# Altium schematic sheet Relay-Sheet.SchDoc
size A4; SheetNumber: 8; SheetTotal: 8
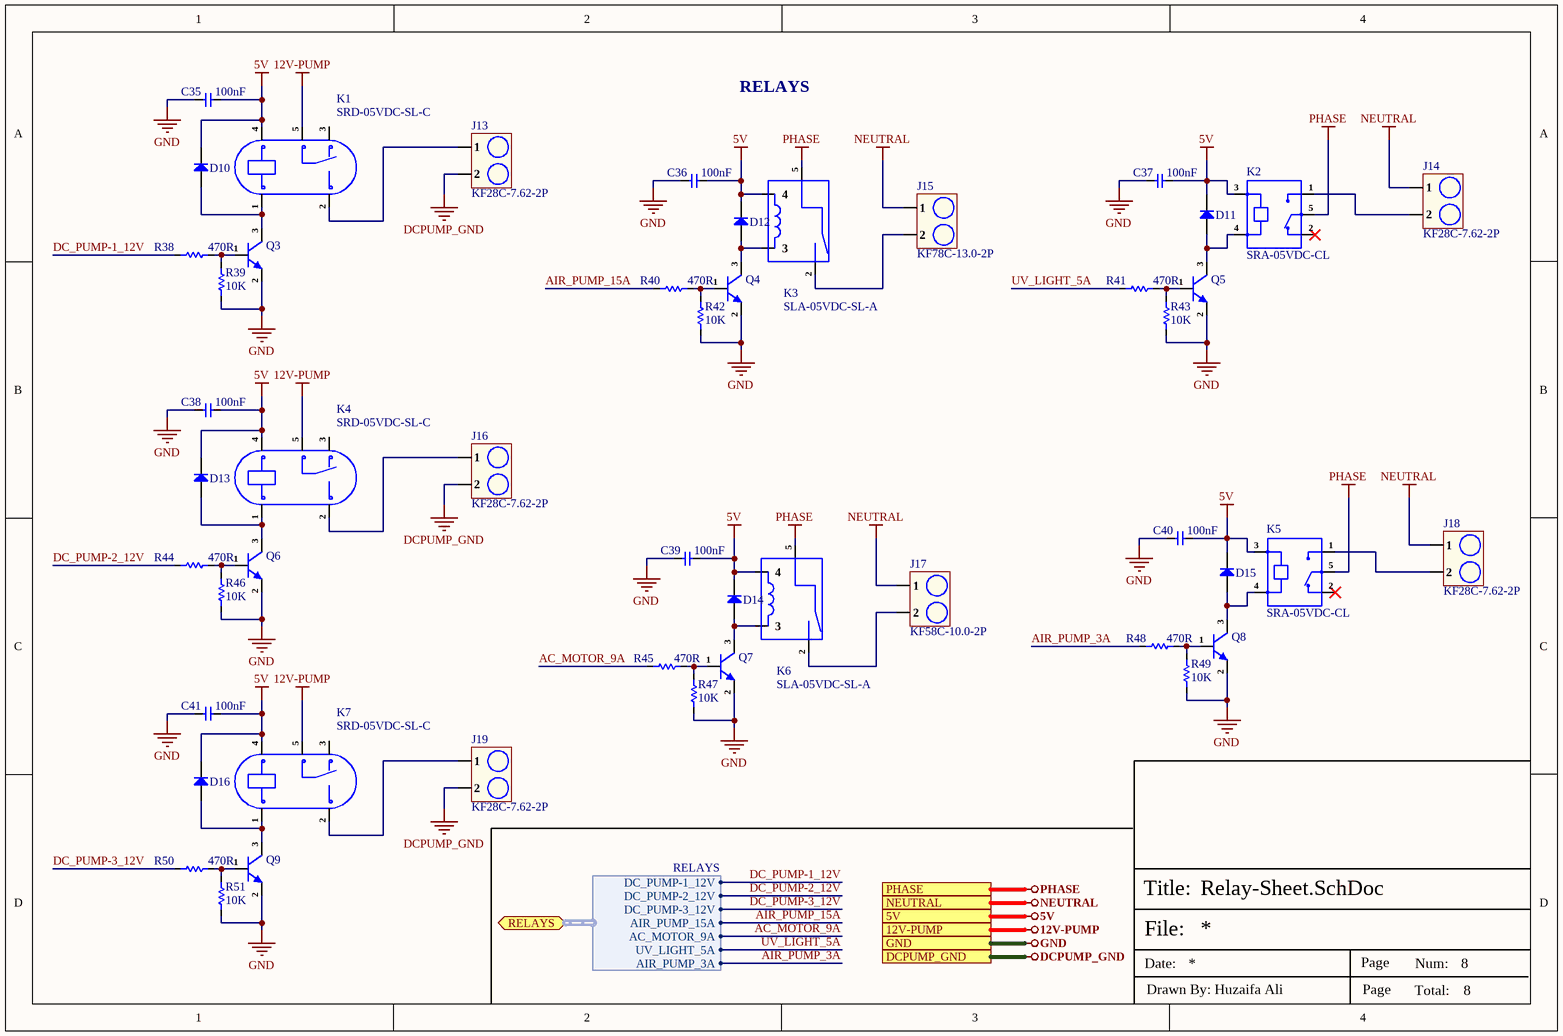
[diagram p0: Relay-Sheet.SchDoc]

## Parts
C35  100nF  [Cap-0603]
C36  100nF  [Cap-0603]
C37  100nF  [Cap-0603]
C38  100nF  [Cap-0603]
C39  100nF  [Cap-0603]
C40  100nF  [Cap-0603]
C41  100nF  [Cap-0603]
D10  1N4148W-7-F  [SOD-123]  (value not drawn)
D11  1N4148W-7-F  [SOD-123]  (value not drawn)
D12  1N4148W-7-F  [SOD-123]  (value not drawn)
D13  1N4148W-7-F  [SOD-123]  (value not drawn)
D14  1N4148W-7-F  [SOD-123]  (value not drawn)
D15  1N4148W-7-F  [SOD-123]  (value not drawn)
D16  1N4148W-7-F  [SOD-123]  (value not drawn)
J13  KF28C-7.62-2P  [KF28C-7.62-2P]
J14  KF28C-7.62-2P  [KF28C-7.62-2P]
J15  KF78C-13.0-2P  [KF78C-13.0-2P]
J16  KF28C-7.62-2P  [KF28C-7.62-2P]
J17  KF58C-10.0-2P  [KF58C-10.0-2P]
J18  KF28C-7.62-2P  [KF28C-7.62-2P]
J19  KF28C-7.62-2P  [KF28C-7.62-2P]
K1  SRD-05VDC-SL-C  [SRD-05VDC-SL-C]
K2  SRA-05VDC-CL  [SRA-05VDC-CL]
K3  SLA-05VDC-SL-A  [SLA-05VDC-SL-A]
K4  SRD-05VDC-SL-C  [SRD-05VDC-SL-C]
K5  SRA-05VDC-CL  [SRA-05VDC-CL]
K6  SLA-05VDC-SL-A  [SLA-05VDC-SL-A]
K7  SRD-05VDC-SL-C  [SRD-05VDC-SL-C]
Q3  MMBT2222A-7-F  [SOT-23]  (value not drawn)
Q4  MMBT2222A-7-F  [SOT-23]  (value not drawn)
Q5  MMBT2222A-7-F  [SOT-23]  (value not drawn)
Q6  MMBT2222A-7-F  [SOT-23]  (value not drawn)
Q7  MMBT2222A-7-F  [SOT-23]  (value not drawn)
Q8  MMBT2222A-7-F  [SOT-23]  (value not drawn)
Q9  MMBT2222A-7-F  [SOT-23]  (value not drawn)
R38  470R  [Res-0603]
R39  10K  [Res-0603]
R40  470R  [Res-0603]
R41  470R  [Res-0603]
R42  10K  [Res-0603]
R43  10K  [Res-0603]
R44  470R  [Res-0603]
R45  470R  [Res-0603]
R46  10K  [Res-0603]
R47  10K  [Res-0603]
R48  470R  [Res-0603]
R49  10K  [Res-0603]
R50  470R  [Res-0603]
R51  10K  [Res-0603]

## Ports
5V (see Top-Sheet[3C], ADC-Sheet[3D], Controller-Sheet[3D], Power-Sheet[3D]), 12V-PUMP (see Top-Sheet[3C], Power-Sheet[3D]), DCPUMP_GND (see Top-Sheet[3C], Power-Sheet[3D]), GND (see Top-Sheet[3C], ADC-Sheet[3D], Buttons-Sheet[3D], Controller-Sheet[3D], IO-Expander-Sheet[3D], Power-Sheet[3D], Sensor-Comms-Sheet[3D]), NEUTRAL (see Top-Sheet[3C], Power-Sheet[3D]), PHASE (see Top-Sheet[3C], Power-Sheet[3D]), RELAYS (bidir, harness RELAYS, see Top-Sheet[4C], IO-Expander-Sheet[2D])

## Harnesses
RELAYS: DC_PUMP-1_12V, DC_PUMP-2_12V, DC_PUMP-3_12V, AIR_PUMP_15A, AC_MOTOR_9A, UV_LIGHT_5A, AIR_PUMP_3A

## Nets
5V: C35.1 C36.1 C37.1 C38.1 C39.1 C40.1 C41.1 D10.2(K) D11.2(K) D12.2(K) D13.2(K) D14.2(K) D15.2(K) D16.2(K) K1.4 K2.3 K3.4 K4.4 K5.3 K6.4 K7.4 ; port 5V
12V-PUMP: K1.5 K4.5 K7.5 ; port 12V-PUMP
DCPUMP_GND: J13.2 J16.2 J19.2 ; port DCPUMP_GND
GND: C35.2 C36.2 C37.2 C38.2 C39.2 C40.2 C41.2 Q3.2(E) Q4.2(E) Q5.2(E) Q6.2(E) Q7.2(E) Q8.2(E) Q9.2(E) R39.1 R42.1 R43.1 R46.1 R47.1 R49.1 R51.1 ; port GND
NEUTRAL: J14.1 J15.1 J17.1 J18.1 ; port NEUTRAL
PHASE: K2.5 K3.5 K5.5 K6.5 ; port PHASE
AC_MOTOR_9A: R45.1 ; port RELAYS.AC_MOTOR_9A
AIR_PUMP_3A: R48.1 ; port RELAYS.AIR_PUMP_3A
AIR_PUMP_15A: R40.1 ; port RELAYS.AIR_PUMP_15A
DC_PUMP-1_12V: R38.1 ; port RELAYS.DC_PUMP-1_12V
DC_PUMP-2_12V: R44.1 ; port RELAYS.DC_PUMP-2_12V
DC_PUMP-3_12V: R50.1 ; port RELAYS.DC_PUMP-3_12V
UV_LIGHT_5A: R41.1 ; port RELAYS.UV_LIGHT_5A
NetD10_1: D10.1(A) K1.1 Q3.3(C)
NetD11_1: D11.1(A) K2.4 Q5.3(C)
NetD12_1: D12.1(A) K3.3 Q4.3(C)
NetD13_1: D13.1(A) K4.1 Q6.3(C)
NetD14_1: D14.1(A) K6.3 Q7.3(C)
NetD15_1: D15.1(A) K5.4 Q8.3(C)
NetD16_1: D16.1(A) K7.1 Q9.3(C)
NetJ13_1: J13.1 K1.2
NetJ14_2: J14.2 K2.1
NetJ15_2: J15.2 K3.2
NetJ16_1: J16.1 K4.2
NetJ17_2: J17.2 K6.2
NetJ18_2: J18.2 K5.1
NetJ19_1: J19.1 K7.2
NetQ3_1: Q3.1(B) R38.2 R39.2
NetQ4_1: Q4.1(B) R40.2 R42.2
NetQ5_1: Q5.1(B) R41.2 R43.2
NetQ6_1: Q6.1(B) R44.2 R46.2
NetQ7_1: Q7.1(B) R45.2 R47.2
NetQ8_1: Q8.1(B) R48.2 R49.2
NetQ9_1: Q9.1(B) R50.2 R51.2

Not connected (* = marked no-connect by the designer): K1 3; K2 2*; K4 3; K5 2*; K7 3

## Notes on the sheet
- RELAYS
- File:
- Title:
- Date:
- Page
- Num:
- Total:
- Drawn By: Huzaifa Ali

## Library data of the parts
C35-C41 = CC0603KRX5R9BB104: CAP CER 0.1UF 50V X5R 0603; Manufacturer: Yageo; Tolerance: 10%; Item Type: Capacitor; Supplier 1: Digi-Key; Manufacturer Part Number: CC0603KRX5R9BB104; RoHS: Yes; Category: Ceramic Capacitors; Stock 1: 152253; Pricing 1: 1=0.10000, 10=0.05200, 50=0.02820, 100=0.02310, 500=0.01648, 1000=0.01294 (USD); Mount: Surface Mount; Case/Package: 0603; Case Code (Imperial): 0603; Case Code (Metric): 1608; Weight: 7.1E-05oz; Min Operating Temperature: -55°C; Max Operating Temperature: 85°C; Capacitance: 100nF; Packaging: Tape and Reel; Voltage Rating: 50V; Dielectric: X5R; Termination: SMD/SMT; Voltage Rating (DC): 50V; Package Quantity: 4000; Length: 0.063inch; Width: 0.031inch; Thickness: 0.035inch; Lead Free: Lead Free; Halogen Free: Halogen Free; ComponentLink1URL: http://www.mouser.com/ds/2/447/Yageo_UPY-GP_NP0_16V-to-50V_9-358835.pdf?src-supplier=Mouser; ComponentLink1Description: http://www.mouser.com/ds/2/447/Yageo_UPY-GP_NP0_16V-to-50V_9-358835.pdf?src-supplier=Mouser; ComponentLink2URL: https://www.yageo.com/upload/media/product/productsearch/datasheet/mlcc/UPY-GPHC_X5R_4V-to-50V_26.pdf?src-supplier=Digi-Key; ComponentLink2Description: https://www.yageo.com/upload/media/product/productsearch/datasheet/mlcc/UPY-GPHC_X5R_4V-to-50V_26.pdf?src-supplier=Digi-Key; ComponentLink3URL: http://www.yageo.com/exep/pages/download/literatures/ProductSelectionGuide%202014_Final_2.pdf?src-supplier=Digi-Key; ComponentLink3Description: http://www.yageo.com/exep/pages/download/literatures/ProductSelectionGuide%202014_Final_2.pdf?src-supplier=Digi-Key; Supplier Part Number 1: 311-4046-1-ND; LCSC Part Number: C110022
D10-D16 = 1N4148W-7-F: DIODE GEN PURP 100V 300MA SOD123; Manufacturer: Diodes; Forward Current: 150mA; Reverse Recovery Time: 4ns; Max Forward Surge Current (Ifsm): 2A; Element Configuration: Single; Max Reverse Current: 1uA; Forward Voltage: 1.25V; Power Dissipation: 400mW; Polarity: Standard; Voltage Rating (DC): 75V; Value: 2pF; Supplier 1: Future Electronics; Manufacturer Part Number: 1N4148W-7-F; RoHS: Yes; Category: Rectifier Diodes; Stock 1: 32931000; Pricing 1: 3000=0.01840, 12000=0.01760, 45000=0.01690, 120000=0.01640, 300000=0.01560 (USD); Mounting Technology: Surface Mount; Pins: 2; Weight: 0.000353oz; Contact Plating: Tin,Matte; Min Operating Temperature: -65°C; Max Operating Temperature: 150°C; Packaging: Tape and Reel; Max Repetitive Reverse Voltage (Vrrm): 100V; Peak Non-Repetitive Surge Current: 2A; Voltage: 100V; Max Surge Current: 2A; Package Quantity: 3000; Recovery Time: 4ns; Average Rectified Current: 300mA; Power Rating: 400mW; Current Rating: 150mA; Output Current: 150mA; Max Reverse Voltage (DC): 100V; Series: -; Reverse Recovery Time-Max: 4ns; Length: 2.85mm; Width: 1.7mm; Height: 1.25mm; Radiation Hardening: No; RoHS Compliant: Yes; Reach SVHC Compliant: Yes; Lead Free: Lead Free; ComponentLink1URL: https://datasheet.ciiva.com/1179/1915529-1179304.pdf?src-supplier=Element14; ComponentLink1Description: https://datasheet.ciiva.com/1179/1915529-1179304.pdf?src-supplier=Element14; ComponentLink2URL: https://datasheet.ciiva.com/22695/1915529-22695239.pdf?src-supplier=Element14; ComponentLink2Description: https://datasheet.ciiva.com/22695/1915529-22695239.pdf?src-supplier=Element14; ComponentLink3URL: https://datasheet.ciiva.com/8300/ds30086-8300392.pdf?src-supplier=Avnet; ComponentLink3Description: https://datasheet.ciiva.com/8300/ds30086-8300392.pdf?src-supplier=Avnet; ComponentLink4URL: https://datasheet.ciiva.com/15219/getdatasheetpartid-110030-15219548.pdf?src-supplier=Verical; ComponentLink4Description: https://datasheet.ciiva.com/15219/getdatasheetpartid-110030-15219548.pdf?src-supplier=Verical; ComponentLink5URL: https://datasheet.ciiva.com/8303/ds30086-8303197.pdf?src-supplier=Avnet; ComponentLink5Description: https://datasheet.ciiva.com/8303/ds30086-8303197.pdf?src-supplier=Avnet; ComponentLink6URL: https://datasheet.ciiva.com/911/ds30086-911735.pdf?src-supplier=Digi-Key; ComponentLink6Description: https://datasheet.ciiva.com/911/ds30086-911735.pdf?src-supplier=Digi-Key; ComponentLink7URL: https://datasheet.ciiva.com/911/ds30086-911736.pdf?src-supplier=Digi-Key; ComponentLink7Description: https://datasheet.ciiva.com/911/ds30086-911736.pdf?src-supplier=Digi-Key; ComponentLink8URL: https://datasheet.ciiva.com/911/ds30086-911734.pdf?src-supplier=Digi-Key; ComponentLink8Description: https://datasheet.ciiva.com/911/ds30086-911734.pdf?src-supplier=Digi-Key; ComponentLink9URL: https://datasheet.ciiva.com/4435/ds30086-4435128.pdf?src-supplier=Mouser; ComponentLink9Description: https://datasheet.ciiva.com/4435/ds30086-4435128.pdf?src-supplier=Mouser; Supplier Part Number 1: 7634694; LCSC Part Number: C83528; Item Type: Diode
J13 J14 J16 J18 J19 = KF28C-7.62-2P: 1x2P Midfoot Barrier Block 2 1 7.62mm 24A -40℃~+105℃ 250V Black 12~22 Straight pin 2.5 Plugin,P=7.62mm Barrier Terminal Blocks ROHS; Manufacturer: CiXi KaiFeng Electronics; Supplier: LCSC; LCSC Part Number: C707609; Manufacturer Part Number: KF28C-7.62-2P; RoHS: No; Item Type: Terminal Block; ComponentLink1Description: LCSC; ComponentLink1URL: https://www.lcsc.com/product-detail/Barrier-Terminal-Blocks_Cixi-Kefa-Elec-KF28C-7-62-2P_C707609.html
J15 = KF78C-13.0-2P: 1x2P Midfoot Barrier Block 2 1 13mm 40A -40℃~+105℃ 750V Black 10~18 Straight pin 6 Plugin,P=13mm Barrier Terminal Blocks ROHS; Manufacturer: CiXi KaiFeng Electronics; Supplier: LCSC; LCSC Part Number: C707721; Manufacturer Part Number: KF78C-13.0-2P; RoHS: No; Item Type: Terminal Block
J17 = KF58C-10.0-2P: 1x2P Midfoot Barrier Block 2 1 10mm -40℃~+105℃ 32A 750V Black 12~22 Straight pin 4 Plugin,P=10mm Barrier Terminal Blocks ROHS; Manufacturer: CiXi KaiFeng Electronics; Supplier: LCSC; LCSC Part Number: C707693; Manufacturer Part Number: KF58C-10.0-2P; RoHS: No; Item Type: Terminal Block; ComponentLink1Description: LCSC; ComponentLink1URL: https://www.lcsc.com/product-detail/Barrier-Terminal-Blocks_Cixi-Kefa-Elec-KF58C-10-0-2P_C707693.html
K1 K4 K7 = SRD-05VDC-SL-C: 250V@AC 5V 15A SPDT (1 Form C) Plugin,15.6x19.2mm Power Relays ROHS; Manufacturer: Ningbo Songle Relay; Manufacturer Part Number: SRD-05VDC-SL-C; Package: Plugin,15.6x19.2mm; LCSC Part Number: C35449; Item Type: Relays; ComponentLink1Description: LCSC; ComponentLink1URL: https://www.lcsc.com/product-detail/Power-Relays_Ningbo-Songle-Relay-SRD-05VDC-SL-C_C35449.html
K2 K5 = SRA-05VDC-CL: 5V 10A 20A@14VAC SPDT (1 Form C) 5 Plugin,12.4x16mm Power Relays ROHS; Manufacturer: Ningbo Songle Relay; Item Type: Relay; Manufacturer Part Number: SRA-05VDC-CL; Package: Plugin,12.4x16mm; LCSC Part Number: C99666; ComponentLink1Description: LCSC; ComponentLink1URL: https://www.lcsc.com/product-detail/Power-Relays_Ningbo-Songle-span-style-background-color-ff0-Relay-span-SRA-05VDC-CL_C99666.html
K3 K6 = SLA-05VDC-SL-A: 250V@AC 5V 30A Normal Open:1A(SPST-Normal Open) Plugin,27.6x32mm Power Relays ROHS; Manufacturer: Ningbo Songle Relay; Item Type: Relay; Manufacturer Part Number: SLA-05VDC-SL-A; Package: Plugin,27.6x32mm; LCSC Part Number: C250645; ComponentLink1Description: LCSC; ComponentLink1URL: https://www.lcsc.com/product-detail/Power-Relays_Ningbo-Songle-Relay-SLA-05VDC-SL-A_C250645.html
Q3-Q9 = MMBT2222A-7-F: TRANS NPN 40V 0.6A SMD SOT23-3; Manufacturer: Diodes; Max Power Dissipation: 300mW; Collector Base Voltage (VCBO): 75V; Max Collector Current: 600mA; hFE Min: 100; Frequency: 300MHz; Number of Elements: 1; Emitter Base Voltage (VEBO): 6V; Collector Emitter Saturation Voltage: 1V; Power Dissipation: 350mW; Element Configuration: Single; Current: 1A; Item Type: Mosfet; Supplier 1: Digi-Key; Manufacturer Part Number: MMBT2222A-7-F; Stock 1: 2471182; Pricing 1: 1=0.15, 10=0.134, 100=0.0729, 500=0.04486, 1000=0.03059 (USD); Mount: Surface Mount; Case/Package: SOT-23; Number of Pins: 3; Weight: 0.000282oz; Contact Plating: Matte,Tin; Min Operating Temperature: -55°C; Max Operating Temperature: 150°C; Packaging: Tape and Reel; Collector Emitter Voltage (VCEO): 40V; Polarity: NPN; Voltage Rating (DC): 40V; Package Quantity: 3000; Continuous Collector Current: 600mA; Collector Emitter Breakdown Voltage: 40V; Transition Frequency: 300MHz; Max Breakdown Voltage: 40V; Max Frequency: 300MHz; Termination: SMD/SMT; Gain Bandwidth Product: 300MHz; Current Rating: 600mA; Voltage: 40V; Length: 3.05mm; Height: 1mm; Width: 1.4mm; Radiation Hardening: No; Lead Free: Lead Free; REACH SVHC: No SVHC; ComponentLink1URL: http://www.diodes.com/datasheets/ds30041.pdf?src-supplier=Future+Electronics; ComponentLink1Description: http://www.diodes.com/datasheets/ds30041.pdf?src-supplier=Future+Electronics; ComponentLink2URL: http://www.diodes.com/datasheets/ds30041.pdf?src-supplier=Avnet; ComponentLink2Description: http://www.diodes.com/datasheets/ds30041.pdf?src-supplier=Avnet; ComponentLink3URL: https://www.verical.com/server-webapp/html/getDatasheet?partID=82692&src-supplier=Verical; ComponentLink3Description: https://www.verical.com/server-webapp/html/getDatasheet?partID=82692&src-supplier=Verical; ComponentLink4URL: https://www.diodes.com/assets/Datasheets/ds30041.pdf?src-supplier=Digi-Key; ComponentLink4Description: https://www.diodes.com/assets/Datasheets/ds30041.pdf?src-supplier=Digi-Key; ComponentLink5URL: http://www.diodes.com/datasheets/ds30041.pdf?src-supplier=Avnet+Europe; ComponentLink5Description: http://www.diodes.com/datasheets/ds30041.pdf?src-supplier=Avnet+Europe; ComponentLink6URL: http://www.diodes.com/datasheets/ds30041.pdf?src-supplier=Element14; ComponentLink6Description: http://www.diodes.com/datasheets/ds30041.pdf?src-supplier=Element14; Supplier Part Number 1: MMBT2222A-FDIDKR-ND; LCSC Part Number: C94515
R38 R40 R41 R44 R45 R48 R50 = RC0603FR-07470RL: RES 470 OHM 1% 1/10W 0603; Manufacturer: Yageo; Power Rating: 100mW; Voltage Rating: 50V; Temperature Coefficient: 100ppm/°C; Working Voltage: 75V; Supplier 1: Digi-Key; Manufacturer Part Number: RC0603FR-07470RL; RoHS: Yes; Category: Chip SMD Resistors; Stock 1: 154083; Pricing 1: 1=0.10000, 10=0.02400, 100=0.00970, 1000=0.00436, 2500=0.00378 (USD); Case/Package: 0603; Case Code (Metric): 1608; Case Code (Imperial): 0603; Min Operating Temperature: -55°C; Max Operating Temperature: 155°C; Tolerance: 1%; Resistance: 470R; Packaging: Tape and Reel; Package Quantity: 1; Resistor Type: Thick Film; Number of Terminations: 2; Termination: SMD/SMT; Max Power Dissipation: 100mW; Features: Moisture Resistant; Series: RC; Technology: THICK FILM; Resistance Tolerance: 1%; Construction: Rectangular; Length: 1.6mm; Width: 0.031inch; Height: 0.022inch; Depth: 0.8mm; RoHS Compliant: Yes; REACH SVHC: No SVHC; Military Standard: Not; Lead Free: Lead Free; ComponentLink1URL: https://datasheet.ciiva.com/11808/0900766b80f96399-11808177.pdf?src-supplier=RSComponents; ComponentLink1Description: https://datasheet.ciiva.com/11808/0900766b80f96399-11808177.pdf?src-supplier=RSComponents; ComponentLink2URL: https://datasheet.ciiva.com/7746/1738695-7746359.pdf?src-supplier=Element14; ComponentLink2Description: https://datasheet.ciiva.com/7746/1738695-7746359.pdf?src-supplier=Element14; ComponentLink3URL: https://datasheet.ciiva.com/7746/1738695-7746360.pdf?src-supplier=Element14; ComponentLink3Description: https://datasheet.ciiva.com/7746/1738695-7746360.pdf?src-supplier=Element14; ComponentLink4URL: https://datasheet.ciiva.com/7660/1868787-7660793.pdf?src-supplier=Element14; ComponentLink4Description: https://datasheet.ciiva.com/7660/1868787-7660793.pdf?src-supplier=Element14; ComponentLink5URL: https://datasheet.ciiva.com/46440/1868787-46440907.pdf?src-supplier=Element14; ComponentLink5Description: https://datasheet.ciiva.com/46440/1868787-46440907.pdf?src-supplier=Element14; ComponentLink6URL: https://datasheet.ciiva.com/2454/pyu-r-int-thick-7-2454012.pdf?src-supplier=Digi-Key; ComponentLink6Description: https://datasheet.ciiva.com/2454/pyu-r-int-thick-7-2454012.pdf?src-supplier=Digi-Key; ComponentLink7URL: https://datasheet.ciiva.com/2454/pyu-r-int-thick-7-2454013.pdf?src-supplier=Digi-Key; ComponentLink7Description: https://datasheet.ciiva.com/2454/pyu-r-int-thick-7-2454013.pdf?src-supplier=Digi-Key; ComponentLink8URL: https://datasheet.ciiva.com/2454/pyu-r-int-thick-7-2454014.pdf?src-supplier=Digi-Key; ComponentLink8Description: https://datasheet.ciiva.com/2454/pyu-r-int-thick-7-2454014.pdf?src-supplier=Digi-Key; Supplier Part Number 1: 311-470HRCT-ND; LCSC Part Number: C114669
R39 R42 R43 R46 R47 R49 R51 = RC0603FR-0710KL: RES SMD 10K Ohm 1% 1/10W 0603; Manufacturer: Yageo; Resistance: 10kR; Temperature Coefficient: 100ppm/°C; Voltage Rating (DC): 50V; Power Rating: 100mW; Voltage Rating: 75V; Item Type: Resistor; Supplier 1: Digi-Key; Manufacturer Part Number: RC0603FR-0710KL; RoHS: Yes; Category: Chip SMD Resistors; Stock 1: 25249139; Pricing 1: 1=0.10000, 10=0.02400, 100=0.00970, 1000=0.00436, 2500=0.00378 (USD); Case/Package: 0603; Number of Pins: 2; Case Code (Imperial): 0603; Case Code (Metric): 1608; Weight: 7.1E-05oz; Size Code: 0603; Min Operating Temperature: -55°C; Max Operating Temperature: 155°C; Tolerance: 1%; Resistor Type: Thick Film; Packaging: Tape and Reel; Termination: SMD/SMT; Features: Moisture Resistant; Series: RC; Max Power Dissipation: 100mW; Number of Terminations: 2; Resistance Tolerance: 1%; Construction: Rectangular; Length: 1.6mm; Width: 0.8mm; Height: 0.45mm; Depth: 0.8mm; Lead Pitch: 0.3mm; REACH SVHC: Unknown; Lead Free: Lead Free; Military Standard: Not; RoHS Compliant: Yes; ComponentLink1URL: https://datasheet.ciiva.com/7660/38590-7660789.pdf?src-supplier=Element14; ComponentLink1Description: https://datasheet.ciiva.com/7660/38590-7660789.pdf?src-supplier=Element14; ComponentLink2URL: https://datasheet.ciiva.com/7983/443971-7983596.pdf?src-supplier=Element14; ComponentLink2Description: https://datasheet.ciiva.com/7983/443971-7983596.pdf?src-supplier=Element14; ComponentLink3URL: https://datasheet.ciiva.com/22747/443971-22747519.pdf?src-supplier=Element14; ComponentLink3Description: https://datasheet.ciiva.com/22747/443971-22747519.pdf?src-supplier=Element14; ComponentLink4URL: https://datasheet.ciiva.com/46440/1868787-46440891.pdf?src-supplier=Element14; ComponentLink4Description: https://datasheet.ciiva.com/46440/1868787-46440891.pdf?src-supplier=Element14; ComponentLink5URL: https://datasheet.ciiva.com/7746/1738695-7746239.pdf?src-supplier=Element14; ComponentLink5Description: https://datasheet.ciiva.com/7746/1738695-7746239.pdf?src-supplier=Element14; ComponentLink6URL: https://datasheet.ciiva.com/15189/getdatasheetpartid-409289-15189591.pdf?src-supplier=Verical; ComponentLink6Description: https://datasheet.ciiva.com/15189/getdatasheetpartid-409289-15189591.pdf?src-supplier=Verical; Supplier Part Number 1: 311-10.0KHRCT-ND; LCSC Part Number: C98220